# Altium schematic sheet ADC_AMPS.SchDoc
size A4; SheetNumber: 3; SheetTotal: 4
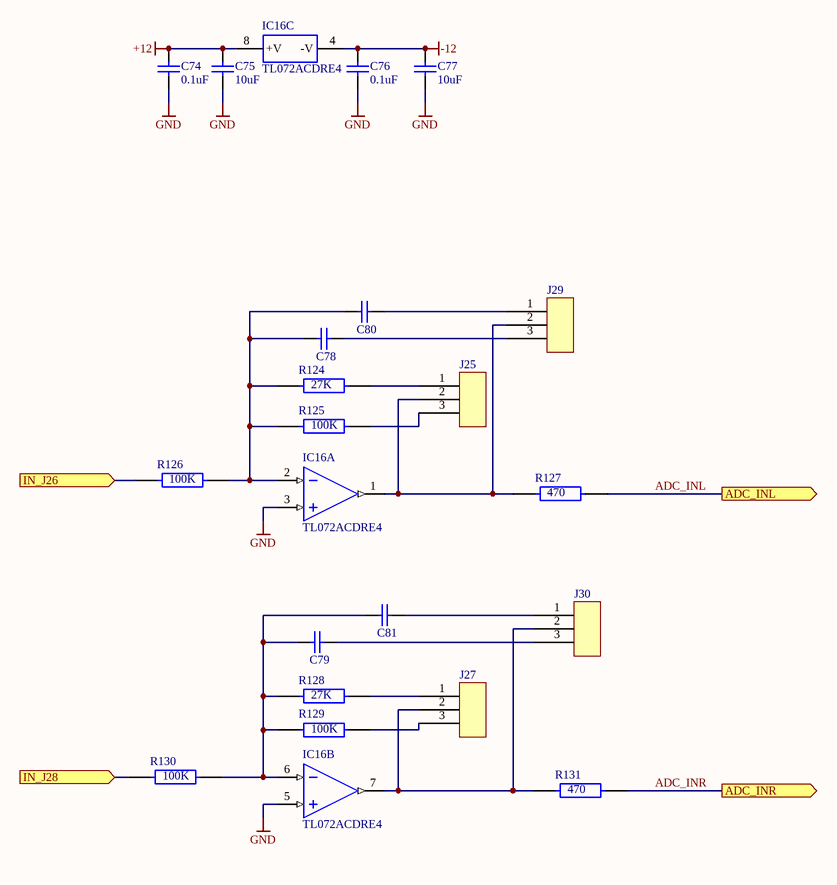
[diagram p0: ADC_AMPS.SchDoc]

## Parts
C74  0.1uF  [CAPC2013X145X48NL20T23]
C75  10uF  [CAPC2013X145X48NL20T23]
C76  0.1uF  [CAPC2013X145X48NL20T23]
C77  10uF  [CAPC2013X145X48NL20T23]
C78  270pF  [CAPC2013X145X48NL20T23]  (value not drawn)
C79  270pF  [CAPC2013X145X48NL20T23]  (value not drawn)
C80  68pF  [CAPC2013X145X48NL20T23]  (value not drawn)
C81  68pF  [CAPC2013X145X48NL20T23]  (value not drawn)
IC16  TL072ACDRE4  [tl072]  (parts A,B,C of 3)
J25  Pinheader_1x3  [HDR_1x3_P2.54]  (value not drawn)
J27  Pinheader_1x3  [HDR_1x3_P2.54]  (value not drawn)
J29  Pinheader_1x3  [HDR_1x3_P2.54]  (value not drawn)
J30  Pinheader_1x3  [HDR_1x3_P2.54]  (value not drawn)
R124  27K  [FP-RN73R2A-IPC_A]
R125  100K  [FP-RN73R2A-IPC_A]
R126  100K  [FP-RN73R2A-IPC_A]
R127  470  [FP-RN73R2A-IPC_A]
R128  27K  [FP-RN73R2A-IPC_A]
R129  100K  [FP-RN73R2A-IPC_A]
R130  100K  [FP-RN73R2A-IPC_A]
R131  470  [FP-RN73R2A-IPC_A]

## Ports
ADC_INL, ADC_INR, IN_J26, IN_J28

## Nets
+12: C74.1 C75.1 IC16.8(+V)
-12: C76.1 C77.1 IC16.4(-V)
GND: C74.2 C75.2 C76.2 C77.2 IC16.3(IN1+) IC16.5(IN2+)
ADC_INL: R127.2 ; port ADC_INL
ADC_INR: R131.2 ; port ADC_INR
IN_J26: R126.1 ; port IN_J26
IN_J28: R130.1 ; port IN_J28
NetC78_1: C78.1 C80.1 IC16.2(IN1-) R124.1 R125.1 R126.2
NetC78_2: C78.2 J29.3
NetC79_1: C79.1 C81.1 IC16.6(IN2-) R128.1 R129.1 R130.2
NetC79_2: C79.2 J30.3
NetC80_2: C80.2 J29.1
NetC81_2: C81.2 J30.1
NetIC16_1: IC16.1(OUT1) J25.2 J29.2 R127.1
NetIC16_7: IC16.7(OUT2) J27.2 J30.2 R131.1
NetJ25_1: J25.1 R124.2
NetJ25_3: J25.3 R125.2
NetJ27_1: J27.1 R128.2
NetJ27_3: J27.3 R129.2

## Library data of the parts
C74-C81 = CAP: Manufacturer: Vitramon; Part Number: VJ0805Y682KXAMT
IC16 = tl072: Low-Noise JFET-Input Operational Amplifier, 7 to 36 V, 0 to 70 degC, 8-pin SOIC (D8), Green (RoHS & no Sb/Br); Manufacturer: Texas Instruments; Vn at 1kHz(Typ)(nV/rtHz): 18; Slew Rate(Typ)(V/us): 13; Rating: Catalog; CMRR(Min)(dB): 75; Total Supply Voltage(Max)(+5V is 5, +/-5V is 10): 36; GBW(Typ)(MHz): 3; Sub Family: General Purpose Amplifier, High Supply Voltage Amplifier (>=30V); Vio (25C)(Max)(mV): 6; Total Supply Voltage(Min)(+5V is 5, +/-5V is 10): 7; Iq per channel(Max)(mA): 2.5; IIB(Max)(pA): 200; Number of Channels: 2; ComponentLink1Description: Manufacturer URL; DatasheetVersion: SLOS080J; ComponentLink1URL: http://www.ti.com/; Eco-Plan: Green (RoHS & no Sb/Br); PackageDescription: 8-Pin Plastic Small Outline, Body 4.9 x 3.9 mm, Pitch 1.27 mm; PackageVersion: 4040047-3/M, 06/2011; Offset Drift(Typ)(uV/C): 18; Mounting Technology: Surface Mount; PackageReference: D8; ComponentLink2Description: Datasheet; ComponentLink3URL: http://www.ti.com/litv/pdf/msoi002j; Code_JEDEC: MS-012; ComponentLink3Description: Package Specification; ComponentLink2URL: http://www.ti.com/lit/ds/symlink/tl072a.pdf; PartNumber: TL072ACDRE4
R124-R131 = Resistor: RES 10K OHM 0.1% 1/8W 0805